# Altium schematic sheet board_a.schdoc
size 400 x 277 mm; Device: default420x297; Symbol: default420x297; Name: default420x297; Size: "A3"; Id: /; File: board_a; Sheet: /
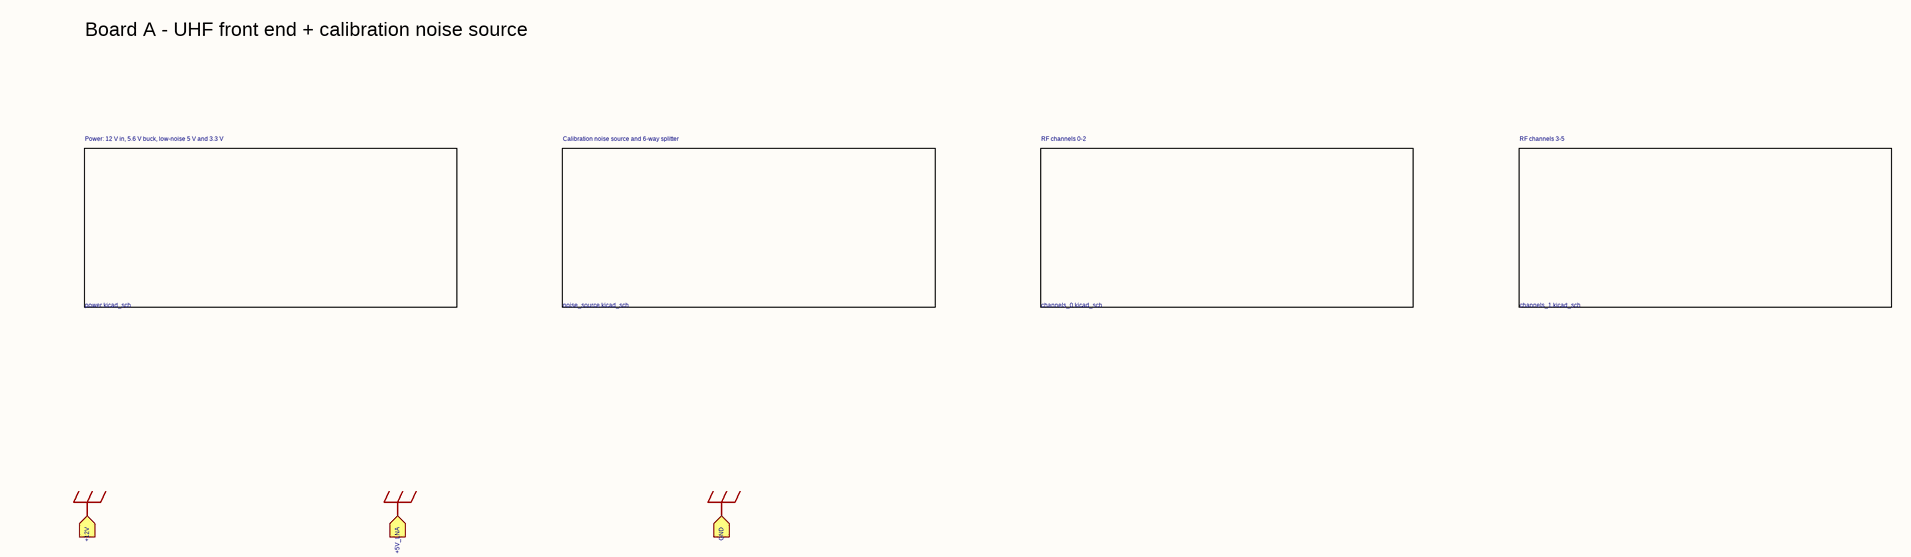
[diagram p0: board_a.schdoc]

## Sub-sheets
CBB? = power.schdoc: no entries  | Symbol: power; Sheetname: Power: 12 V in, 5.6 V buck, low-noise 5 V and 3.3 V; Sheetfile: power.kicad_sch
CBB? = noise_source.schdoc: no entries  | Symbol: noise_source; Sheetname: Calibration noise source and 6-way splitter; Sheetfile: noise_source.kicad_sch
CBB? = channels_0.schdoc: no entries  | Symbol: channels_0; Sheetname: RF channels 0-2; Sheetfile: channels_0.kicad_sch
CBB? = channels_1.schdoc: no entries  | Symbol: channels_1; Sheetname: RF channels 3-5; Sheetfile: channels_1.kicad_sch

## Ports
+5V_LNA (in), +12V (in), GND (in)

## Nets
power_PWR_FLAG: port +12V, port +5V_LNA, port GND

## Notes on the sheet
- Board A - UHF front end + calibration noise source
- 1
- 2
- 3
- 4
- 5
- 6
- 7
- 8
- A
- B
- C
- D
- E
- Size:"A3"
- Title:
- File:board_a
- Sheet:/
- Date:
- Rev:
- F
- Id:/